# Altium schematic sheet Touch.SchDoc
size A4
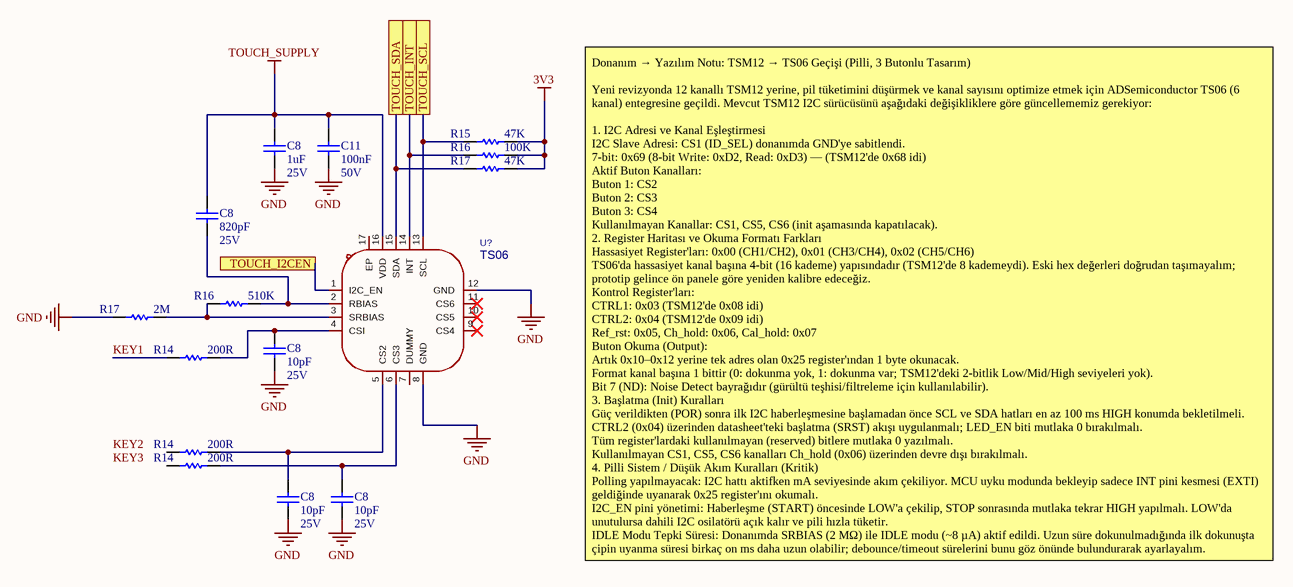
[diagram p0: Touch.SchDoc]

## Parts
(Parts that share a designator on the sheet are numbered #1, #2 ... from top to bottom, then left to right.)
C8#1  value 1uF  Voltage: 25V  [CAP_0603]  (hidden comment: CL10A105KA8NNNC)
C8#2  value 820pF  Voltage: 25V  [CAP_0603]  (hidden comment: CL10A105KA8NNNC)
C8#3  value 10pF  Voltage: 25V  [CAP_0603]  (hidden comment: CL10A105KA8NNNC)
C8#4  value 10pF  Voltage: 25V  [CAP_0603]  (hidden comment: CL10A105KA8NNNC)
C8#5  value 10pF  Voltage: 25V  [CAP_0603]  (hidden comment: CL10A105KA8NNNC)
C11  value 100nF  Voltage: 50V  [CAP_0603]  (hidden comment: CAP)
R14#1  value 200R  [RES_0603]  (hidden comment: RES)
R14#2  value 200R  [RES_0603]  (hidden comment: RES)
R14#3  value 200R  [RES_0603]  (hidden comment: RES)
R15  value 47K  [RES_0603]  (hidden comment: RES)
R16#1  value 100K  [RES_0603]  (hidden comment: RES)
R16#2  value 510K  [RES_0603]  (hidden comment: RES)
R17#1  value 47K  [RES_0603]  (hidden comment: RES)
R17#2  value 2M  [RES_0603]  (hidden comment: RES)
U?  TS06  [QFN-16_L3.0-W3.0-P0.50-BL-EP2.0]

## Ports
TOUCH_I2CEN, TOUCH_INT, TOUCH_SCL, TOUCH_SDA

## Nets
3V3: R15.2 R16#1.2 R17#1.2
GND: C8#1.2 C8#3.2 C8#4.2 C8#5.2 C11.2 R17#2.1 U?.8(GND) U?.12(GND)
TOUCH_SUPPLY: C8#1.1 C8#2.1 C11.1 U?.16(VDD)
KEY1: R14#1.1
TOUCH_I2CEN: U?.1(I2C_EN) ; port TOUCH_I2CEN
TOUCH_INT: R16#1.1 U?.14(INT) ; port TOUCH_INT
TOUCH_SCL: R15.1 U?.13(SCL) ; port TOUCH_SCL
TOUCH_SDA: R17#1.1 U?.15(SDA) ; port TOUCH_SDA
NetC8#2_2: C8#2.2 R16#2.2 U?.2(RBIAS)
NetC8#3_1: C8#3.1 R14#1.2 U?.4(CSI)
NetC8#4_1: C8#4.1 R14#2.2 U?.5(CS2)
NetC8#5_1: C8#5.1 R14#3.2 U?.6(CS3)
NetR16#2_1: R16#2.1 R17#2.2 U?.3(SRBIAS)

Not connected (* = marked no-connect by the designer): R14#2 1; R14#3 1; U? 7(DUMMY) 9(CS4)* 10(CS5)* 11(CS6)* 17(EP)

## Notes on the sheet
- Donanım → Yazılım Notu: TSM12 → TS06 Geçişi (Pilli, 3 Butonlu Tasarım)
  Yeni revizyonda 12 kanallı TSM12 yerine, pil tüketimini düşürmek ve kanal sayısını optimize etmek için ADSemiconductor TS06 (6 kanal) entegresine geçildi. Mevcut TSM12 I2C sürücüsünü aşağıdaki değişikliklere göre güncellememiz gerekiyor:
  1. I2C Adresi ve Kanal Eşleştirmesi
  I2C Slave Adresi: CS1 (ID_SEL) donanımda GND'ye sabitlendi.
  7-bit: 0x69 (8-bit Write: 0xD2, Read: 0xD3) — (TSM12'de 0x68 idi)
  Aktif Buton Kanalları:
  Buton 1: CS2
  Buton 2: CS3
  Buton 3: CS4
  Kullanılmayan Kanallar: CS1, CS5, CS6 (init aşamasında kapatılacak).
  2. Register Haritası ve Okuma Formatı Farkları
  Hassasiyet Register'ları: 0x00 (CH1/CH2), 0x01 (CH3/CH4), 0x02 (CH5/CH6)
  TS06'da hassasiyet kanal başına 4-bit (16 kademe) yapısındadır (TSM12'de 8 kademeydi). Eski hex değerleri doğrudan taşımayalım; prototip gelince ön panele göre yeniden kalibre edeceğiz.
  Kontrol Register'ları:
  CTRL1: 0x03 (TSM12'de 0x08 idi)
  CTRL2: 0x04 (TSM12'de 0x09 idi)
  Ref_rst: 0x05, Ch_hold: 0x06, Cal_hold: 0x07
  Buton Okuma (Output):
  Artık 0x10–0x12 yerine tek adres olan 0x25 register'ından 1 byte okunacak.
  Format kanal başına 1 bittir (0: dokunma yok, 1: dokunma var; TSM12'deki 2-bitlik Low/Mid/High seviyeleri yok).
  Bit 7 (ND): Noise Detect bayrağıdır (gürültü teşhisi/filtreleme için kullanılabilir).
  3. Başlatma (Init) Kuralları
  Güç verildikten (POR) sonra ilk I2C haberleşmesine başlamadan önce SCL ve SDA hatları en az 100 ms HIGH konumda bekletilmeli.
  CTRL2 (0x04) üzerinden datasheet'teki başlatma (SRST) akışı uygulanmalı; LED_EN biti mutlaka 0 bırakılmalı.
  Tüm register'lardaki kullanılmayan (reserved) bitlere mutlaka 0 yazılmalı.
  Kullanılmayan CS1, CS5, CS6 kanalları Ch_hold (0x06) üzerinden devre dışı bırakılmalı.
  4. Pilli Sistem / Düşük Akım Kuralları (Kritik)
  Polling yapılmayacak: I2C hattı aktifken mA seviyesinde akım çekiliyor. MCU uyku modunda bekleyip sadece INT pini kesmesi (EXTI) geldiğinde uyanarak 0x25 register'ını okumalı.
  I2C_EN pini yönetimi: Haberleşme (START) öncesinde LOW'a çekilip, STOP sonrasında mutlaka tekrar HIGH yapılmalı. LOW'da unutulursa dahili I2C osilatörü açık kalır ve pili hızla tüketir.
  IDLE Modu Tepki Süresi: Donanımda SRBIAS (2 MΩ) ile IDLE modu (~8 µA) aktif edildi. Uzun süre dokunulmadığında ilk dokunuşta çipin uyanma süresi birkaç on ms daha uzun olabilir; debounce/timeout sürelerini bunu göz önünde bulundurarak ayarlayalım.
- Labels drawn without touching a wire or pin: KEY2, KEY3
- Title
- Size:
- Date:
- A4
- Number:
- Rev.Number:
- Revision:
- Drawer/
- Sheet
- of
- YALIM
- Burak
- TURKEY
- File:

## Library data of the parts
C8#1-C8#5 = C01757: CAP CER 1UF 25VDC %10 X5R SMD; Manufacturer: Samsung; Manufacturer Part Number: CL10A105KA8NNNC
C11 = C01763: CAP CER 100nF 50VDC %10 X7R SMD; Manufacturer: Samsung; Manufacturer Part Number: CL10B104KB8NNNL
R14#1-R14#3 R15 R16#1 R16#2 R17#1 R17#2 = R03000: RES 0603 47K Ohms 1% 1/10W-S 100PPM; Manufacturer: ROYALOHM; Manufacturer Part Number: 0603SAF4702T5E
U? = TS06: Number of Channels:6 Features:Capacitive Touch；PWM Control；Automatic sensitivity calibration；Integrated LED driver Whether the Lock:- Voltage - Supply:2.5V~5V Voltage - Supply:2.5V~5V Current - Supply:80uA Operating Temperature:-20℃~+75℃ Operating Tempera; Manufacturer: AD Semiconductor; AddInBom: yes; ModelId: 70b6265379b441acae380b40a6ebf137; ModelName: QFN-16_L3.0-W3.0-P0.50-EP2.0; ModelTransform: 118.8974,118.8974,0,90,0,0,0,0,0; Number of Channels: 6; Current - Supply: 80uA; Standby Current: 8uA; ESD Protection Voltage: 5kV; Symbol: TS06; LCSC Part Name: 6通道自动灵敏度校准电容式触摸传感器; SupplierPart: C132386; ManufacturerPart: TS06; Supplier Footprint: QFN-16-EP(3x3); JLCPCB Part Class: Extended Part; Datasheet: https://item.szlcsc.com/datasheet/TS06/143685.html; Supplier: LCSC; ConvertToPcb: yes; FootprintName: QFN-16_L3.0-W3.0-P0.50-BL-EP2.0; Features: Capacitive Touch；PWM Control；Automatic sensitivity calibration；Integrated LED driver; Whether the Lock: -; Voltage - Supply: 2.5V~5V; Operating Temperature: -20℃~+75℃; Response Time (tr): -